# Altium project RheoBoard_V1.PrjPcb (part 2 of 5)
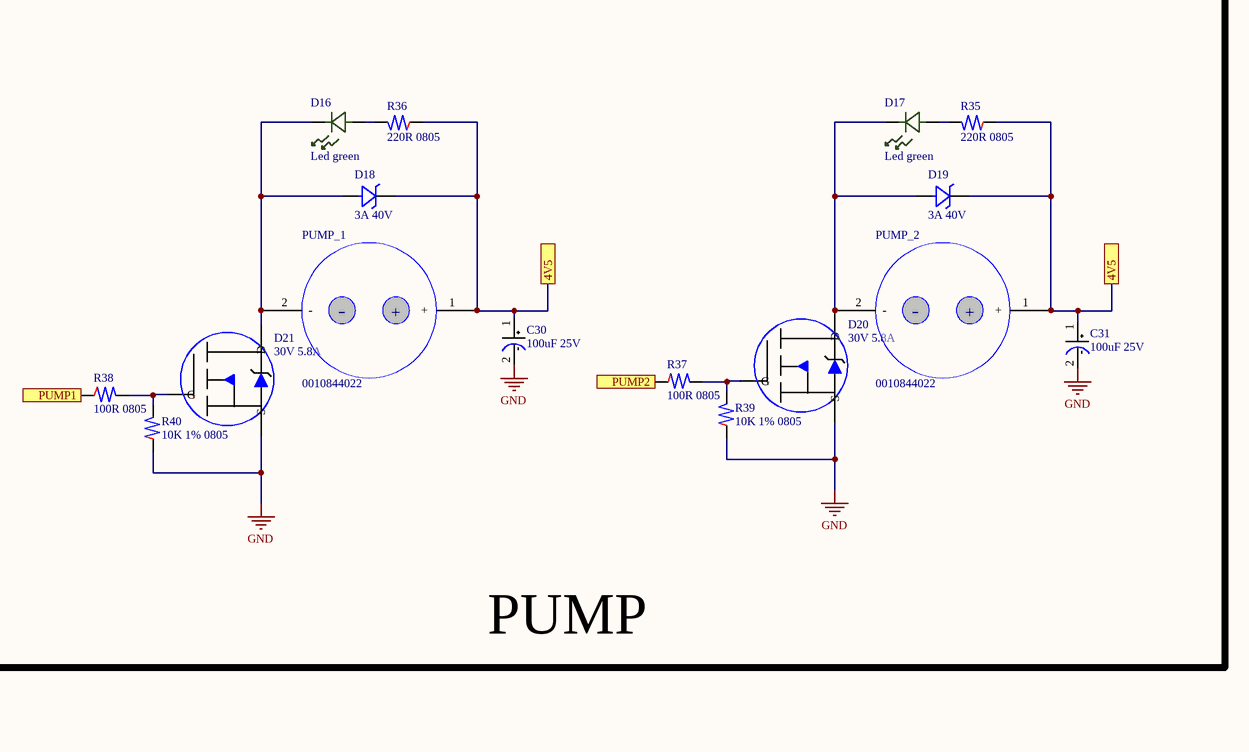
[diagram p11: MAIN.SchDoc, right]

## Sheet MAIN.SchDoc (continued)
### Library data of the parts
C1-C3 C5 C6 = CAP_CER, 0805, X7R, 0.1UF, 5%, 50V: Ceramic Capacitor, Multilayer, Ceramic, 50V, 10% +Tol, 10% -Tol, X7R, 15% TC, 0.1uF, Surface Mount, 0805; Manufacturer: Nextgen; Manufacturer Part Number: 0805B104K500BD; Capacitance: 100nF; LIB MADE BY: MR HOANG; Supplier 1: DigiKey Marketplace; RoHS: Compliant; Category: Ceramic Capacitors; Stock 1: 24000; Pricing 1: 8000=0.0788 (USD); Dielectric Material: Ceramic; Export Control Classification Number (ECCN) Code: EAR99; Height: 850µm; Harmonized Tariff Schedule (HTS) Code: 8532.24.00.20; Length: 2mm; Max Operating Temperature: 125°C; Min Operating Temperature: -55°C; Mount: Surface Mount; Number of Terminals: 2; REACH SVHC: Yes; Voltage Rating (DC): 50V; Width: 1.25mm; ComponentLink1Description: New link; ComponentLink1URL: *; LINK: https://linhkien.cxtvn.com/1976-tu-khong-phan-cuc-0805.html; Supplier Part Number 1: 3372-0805B104K500BDTR-ND
C4 = CAP_CER 0805 1NF 50V ULTRA STABL: Cap Ceramic 0.001uF 50V X8R 10% Pad SMD 0805 150C T/R Automotive AEC-Q200; Manufacturer: Yageo Group; Manufacturer Part Number: C0805C102K5HACAUTO; Temperature Coefficient: 30ppm/°C; LIB MADE BY: MR HOANG; Supplier 1: DigiKey; RoHS: Compliant; Category: Ceramic Capacitors; Stock 1: 54307; Pricing 1: 1=0.18, 10=0.1, 50=0.07, 100=0.0608, 500=0.0454 (USD); Capacitance: 1nF; Case/Package: 0805; China RoHS: Compliant; Country of Origin: Mexico; Dielectric: X8R; Dielectric Material: Ceramic; Export Control Classification Number (ECCN) Code: EAR99; Height: 780µm; Harmonized Tariff Schedule (HTS) Code: 8532.24.00.20; Introduction Date: 2017-10-02; Lead Free: Lead Free; Length: 2mm; Lifecycle Status: Production; Material: Ceramic; Max Operating Temperature: 150°C; Min Operating Temperature: -55°C; Mount: Surface Mount; Number of Terminals: 2; Ratings: AEC-Q200; REACH SVHC: Yes; Voltage Rating: 50V; Voltage Rating (DC): 50V; Width: 1.25mm; ComponentLink1URL: https://datasheet.octopart.com:443/C0805C102K5HACAUTO-KEMET-datasheet-178087918.pdf?src-supplier=IHS; ComponentLink1Description: https://datasheet.octopart.com:443/C0805C102K5HACAUTO-KEMET-datasheet-178087918.pdf?src-supplier=IHS; ComponentLink2URL: https://datasheet.octopart.com:443/C0805C102K5HACAUTO-KEMET-datasheet-68331921.pdf?src-supplier=Upverter; ComponentLink2Description: https://datasheet.octopart.com:443/C0805C102K5HACAUTO-KEMET-datasheet-68331921.pdf?src-supplier=Upverter; ComponentLink3URL: https://datasheet.octopart.com:443/C0805C102K5HACAUTO-KEMET-datasheet-181957571.pdf?src-supplier=Newark; ComponentLink3Description: https://datasheet.octopart.com:443/C0805C102K5HACAUTO-KEMET-datasheet-181957571.pdf?src-supplier=Newark; ComponentLink4URL: https://datasheet.octopart.com:443/C0805C102K5HACAUTO-KEMET-datasheet-181957570.pdf?src-supplier=Newark; ComponentLink4Description: https://datasheet.octopart.com:443/C0805C102K5HACAUTO-KEMET-datasheet-181957570.pdf?src-supplier=Newark; ComponentLink5URL: https://datasheet.octopart.com:443/C0805C102K5HACAUTO-KEMET-datasheet-149523697.pdf?src-supplier=Farnell; ComponentLink5Description: https://datasheet.octopart.com:443/C0805C102K5HACAUTO-KEMET-datasheet-149523697.pdf?src-supplier=Farnell; ComponentLink6URL: https://datasheet.octopart.com:443/C0805C102K5HACAUTO-KEMET-datasheet-138896532.pdf?src-supplier=Farnell; ComponentLink6Description: https://datasheet.octopart.com:443/C0805C102K5HACAUTO-KEMET-datasheet-138896532.pdf?src-supplier=Farnell; ComponentLink7URL: https://datasheet.octopart.com/C0805C102K5HACAUTO-KEMET-datasheet-84169754.pdf; ComponentLink7Description: https://datasheet.octopart.com/C0805C102K5HACAUTO-KEMET-datasheet-84169754.pdf; Supplier Part Number 1: 399-C0805C102K5HACAUTODKR-ND; LINK: https://linhkien.cxtvn.com/3023-tu-102-1nf-0805-50v-10-20c.html
C28-C31 = CAP ALUM POLY 100UF 20% 25V SMD: WCAP-PSLC Aluminum Polymer Capacitors; Manufacturer: Wurth Elektronik; Manufacturer Part Number: 875075561005; Manufacturer Lifecycle Status: ACTIVE; Capacitance: 100µF; ESR (Equivalent Series Resistance): 15mΩ; Leakage Current: 500µA; Life (Hours): 2000hours; Pitch: 10.3mm; Polarity: Polar; Ripple Current: 4.8A; Tolerance: 20%; YEOL: 1 = Estimated lifetime > 10 years; LIB MADE BY: MR HOANG; Supplier 1: DigiKey; RoHS: Compliant; Category: Polymer Capacitors; Stock 1: 825; Pricing 1: 1=1.6, 50=1.363, 100=1.187 (USD); Case/Package: Radial; Diameter: 10mm; Height - Seated (Max): 12.3952mm; Length: 12.4mm; Lifecycle Status: Production; Max Operating Temperature: 105°C; Min Operating Temperature: -55°C; Mount: Surface Mount; Packaging: Tape & Reel (TR); REACH SVHC: Unknown; Voltage Rating: 25V; Voltage Rating (DC): 25V; Width: 10.3mm; ComponentLink1URL: https://datasheet.octopart.com:443/875075561005-Wurth-Elektronik-datasheet-168509076.pdf?src-supplier=Wurth+Elektronik; ComponentLink1Description: https://datasheet.octopart.com:443/875075561005-Wurth-Elektronik-datasheet-168509076.pdf?src-supplier=Wurth+Elektronik; ComponentLink2URL: https://datasheet.octopart.com:443/875075561005-W%C3%BCrth-Elektronik-datasheet-37144729.pdf?src-supplier=Newark; ComponentLink2Description: https://datasheet.octopart.com:443/875075561005-W%C3%BCrth-Elektronik-datasheet-37144729.pdf?src-supplier=Newark; Supplier Part Number 1: 732-6499-6-ND; LINK: https://linhkien.cxtvn.com/7789-edk107m025a9laa-cap-alum-100uf-20-25v-smd-8383mm.html
D1 D3 D5 D7 D14 D15 D20 D21 = MOSFET N-CH 30V 5.8A SOT23-3: Trans MOSFET N-CH 30V 5.7A 3-Pin SOT-23; Manufacturer: Alpha & Omega Semiconductor; Manufacturer Part Number: AO3400A; Drain to Source Resistance: 26.5mΩ; Gate to Source Voltage (Vgs): 12V; Input Capacitance: 630pF; Max Junction Temperature (Tj): 150°C; Max Power Dissipation: 1.4W; Number of Channels: 1; Threshold Voltage: 650mV; Turn-Off Delay Time: 25ns; Turn-On Delay Time: 3ns; LIB MADE BY: MR HOANG; Supplier 1: DigiKey; RoHS: Compliant; Category: MOSFETs; Stock 1: 170121; Pricing 1: 3000=0.11563, 6000=0.10504, 9000=0.09963, 15000=0.09356, 21000=0.08996, 30000=0.08647 (USD); Case/Package: SOT-23; Continuous Drain Current (ID): 5.7A; Country of Origin: Mainland China; Drain to Source Breakdown Voltage: 30V; Drain to Source Voltage (Vdss): 30V; Export Control Classification Number (ECCN) Code: EAR99; Height: 1.25mm; Introduction Date: 2007-04-17; Lead Free: Lead Free; Lifecycle Status: Production; Max Operating Temperature: 150°C; Min Breakdown Voltage: 30V; Min Operating Temperature: -55°C; Mount: Surface Mount; Number of Elements: 1; Number of Pins: 3; Number of Terminals: 3; Power Dissipation: 1.4W; Radiation Hardening: No; Rds On Max: 26.5mΩ; REACH SVHC: Yes; Schedule B: 8541290080, 8541290080|8541290080|8541290080|8541290080|8541290080; ComponentLink1URL: https://sigma.octopart.com:443/140150677/technical_drawing/Alpha-%26-Omega-Semiconductor-AO3400A.pdf?src-supplier=Alpha+%26+Omega+Semiconductor+SCT; ComponentLink1Description: https://sigma.octopart.com:443/140150677/technical_drawing/Alpha-%26-Omega-Semiconductor-AO3400A.pdf?src-supplier=Alpha+%26+Omega+Semiconductor+SCT; ComponentLink2URL: https://datasheet.octopart.com:443/AO3400A-Alpha-%26-Omega-Semiconductor-datasheet-11777925.pdf?src-supplier=IHS; ComponentLink2Description: https://datasheet.octopart.com:443/AO3400A-Alpha-%26-Omega-Semiconductor-datasheet-11777925.pdf?src-supplier=IHS; ComponentLink3URL: https://sigma.octopart.com:443/138895710/technical_drawing/Alpha-%26-Omega-Semiconductor-AO3400A.pdf?src-supplier=Upverter; ComponentLink3Description: https://sigma.octopart.com:443/138895710/technical_drawing/Alpha-%26-Omega-Semiconductor-AO3400A.pdf?src-supplier=Upverter; ComponentLink4URL: https://datasheet.octopart.com:443/AO3400A-Alpha-%26-Omega-Semiconductor-datasheet-14060799.pdf?src-supplier=iiiC; ComponentLink4Description: https://datasheet.octopart.com:443/AO3400A-Alpha-%26-Omega-Semiconductor-datasheet-14060799.pdf?src-supplier=iiiC; ComponentLink5URL: https://datasheet.octopart.com:443/AO3400A-Alpha-%26-Omega-Semiconductor-datasheet-5402508.pdf?src-supplier=Verical; ComponentLink5Description: https://datasheet.octopart.com:443/AO3400A-Alpha-%26-Omega-Semiconductor-datasheet-5402508.pdf?src-supplier=Verical; Supplier Part Number 1: 785-1000-2-ND; LINK: https://linhkien.cxtvn.com/2689-ao3400-mosfet-n-ch-30v-58a-sot23-3-2c.html
D10 D11 D16 D17 LED4-LED6 = LED GREEN CLEAR CHIP SMD: Single-color LEDs; LITEON; LTST-C190GKT; Green; 130 °; 2.1 V; 0603; Manufacturer: Diodes Inc.; Current: 1A; Dominant Wavelength: 569nm; Forward Current: 30mA; Forward Voltage: 2.6V; Lens Color: Clear, Colorless; Lens Style: Clear; Luminous Intensity: 1.8mcd; Number of Circuits: 1; Peak Wavelength: 565nm; Power Dissipation: 100mW; Reverse Voltage: 5V; Shape: Rectangular; Test Current: 10mA; Viewing Angle: 130°; Voltage: 2V; LIB MADE BY: MR HOANG; Supplier: DigiKey; Supplier Part Number: 160-LTST-C190GKTDKR-ND; Manufacturer Part Number: LTST-C190GKT; RoHS: Compliant; Category: LEDs; Stock: 1226903; Pricing: 1=0.14, 10=0.096, 100=0.0662, 500=0.05232, 1000=0.0477, 2000=0.04374 (USD); Case/Package: 0603; Case Code (Imperial): 0603; Case Code (Metric): 1608; China RoHS: Compliant; Color: Green; Contact Plating: Tin; Country of Origin: Mainland China; Depth: 800µm; Export Control Classification Number (ECCN) Code: EAR99; Height: 800µm; Harmonized Tariff Schedule (HTS) Code: 8541.40.20.00; Illumination Color: Green; Introduction Date: 1997-12-01; Lead Free: Lead Free; Length: 1.6mm; Lens Transparency: Clear; Lifecycle Status: NRND; Max Operating Temperature: 85°C; Min Operating Temperature: -55°C; Mounting Technology: Surface Mount; Number of Elements: 1; Number of LEDs: 1; Pins: 2; Number of Terminals: 2; Power Rating: 100mW; Radiation Hardening: No; REACH SVHC: Yes; Schedule B: 8541402000, 8541402000|8541402000|8541402000|8541402000|8541402000; Terminal Pitch: 1.5mm; Wavelength: 569nm; Width: 800µm; ComponentLink1URL: https://datasheet.octopart.com:443/LTST-C190GKT-Lite-On-datasheet-66499085.pdf?src-supplier=IHS; ComponentLink1Description: https://datasheet.octopart.com:443/LTST-C190GKT-Lite-On-datasheet-66499085.pdf?src-supplier=IHS; ComponentLink2URL: https://datasheet.octopart.com:443/LTST-C190GKT-Lite-On-datasheet-158530.pdf?src-supplier=Electro+Sonic; ComponentLink2Description: https://datasheet.octopart.com:443/LTST-C190GKT-Lite-On-datasheet-158530.pdf?src-supplier=Electro+Sonic; ComponentLink3URL: https://datasheet.octopart.com:443/LTST-C190GKT-Lite-On-datasheet-87079182.pdf?src-supplier=Upverter; ComponentLink3Description: https://datasheet.octopart.com:443/LTST-C190GKT-Lite-On-datasheet-87079182.pdf?src-supplier=Upverter; ComponentLink4URL: https://datasheet.octopart.com:443/LTST-C190GKT-Lite-On-datasheet-7279162.pdf?src-supplier=Future+Electronics; ComponentLink4Description: https://datasheet.octopart.com:443/LTST-C190GKT-Lite-On-datasheet-7279162.pdf?src-supplier=Future+Electronics; ComponentLink5URL: https://datasheet.octopart.com:443/LTST-C190GKT-Lite-On-datasheet-86397319.pdf?src-supplier=Future+Electronics; ComponentLink5Description: https://datasheet.octopart.com:443/LTST-C190GKT-Lite-On-datasheet-86397319.pdf?src-supplier=Future+Electronics; ComponentLink6URL: https://datasheet.octopart.com:443/LTST-C190GKT-Lite-On-datasheet-93383.pdf?src-supplier=DigiKey; ComponentLink6Description: https://datasheet.octopart.com:443/LTST-C190GKT-Lite-On-datasheet-93383.pdf?src-supplier=DigiKey; ComponentLink7URL: https://datasheet.octopart.com:443/LTST-C190GKT-Lite-On-datasheet-14174996.pdf?src-supplier=iiiC; ComponentLink7Description: https://datasheet.octopart.com:443/LTST-C190GKT-Lite-On-datasheet-14174996.pdf?src-supplier=iiiC; ComponentLink8URL: https://datasheet.octopart.com:443/LTST-C190GKT-Lite-On-datasheet-62340971.pdf?src-supplier=TME; ComponentLink8Description: https://datasheet.octopart.com:443/LTST-C190GKT-Lite-On-datasheet-62340971.pdf?src-supplier=TME; Link: https://www.thegioiic.com/led-xanh-la-0603-dan-smd-trong-suot
D12 D13 D18 D19 = DIODE SCHOTTKY 40V 3A DO214AB: Rectifier Diode, Schottky, 1 Phase, 1 Element, 3A, 40V V(RRM), Silicon, DO-214AB; Manufacturer: onsemi; Manufacturer Part Number: SS34; Manufacturer Lifecycle Status: ACTIVE; Element Configuration: Single; Forward Voltage: 500mV; Max Forward Surge Current (Ifsm): 100A; Max Junction Temperature (Tj): 150°C; Max Power Dissipation: 2.27W; Max Reverse Leakage Current: 500µA; Number of Elements: 1; Peak Reverse Current: 20mA; Polarity: Standard; LIB MADE BY: MR HOANG; Supplier 1: DigiKey; RoHS: Compliant; Category: Schottky Diodes; Stock 1: 73284; Pricing 1: 1=1.01, 10=0.631, 100=0.4108, 500=0.31576, 1000=0.28514 (USD); Average Rectified Current: 3A; Case/Package: SMC; China RoHS: Non-Compliant; Contact Plating: Tin; Current: 3A; Current Rating: 3A; Export Control Classification Number (ECCN) Code: EAR99; Forward Current: 3A; Height: 2.65mm; Harmonized Tariff Schedule (HTS) Code: 8541.10.00.80; Introduction Date: 1999-01-01; Lead Free: Lead Free; Length: 7.15mm; Lifecycle Status: Production; Max Operating Temperature: 150°C; Max Output Current: 3A; Max Repetitive Reverse Voltage (Vrrm): 40V; Max Reverse Voltage (DC): 40V; Max Surge Current: 100A; Min Operating Temperature: -55°C; Mount: Surface Mount; Number of Pins: 2; Number of Terminals: 2; Output Current: 3A; Packaging: Cut Tape; Peak Non-Repetitive Surge Current: 100A; Radiation Hardening: No; REACH SVHC: No; Reverse Standoff Voltage: 40V; Schedule B: 8541100080, 8541100080|8541100080|8541100080|8541100080|8541100080; Voltage: 40V; Voltage Rating (DC): 40V; Width: 6.25mm; ComponentLink1URL: https://datasheet.octopart.com:443/SS34-onsemi-datasheet-180969540.pdf?src-supplier=IHS; ComponentLink1Description: https://datasheet.octopart.com:443/SS34-onsemi-datasheet-180969540.pdf?src-supplier=IHS; ComponentLink2URL: https://datasheet.octopart.com:443/SS34-Fairchild-Semiconductor-datasheet-182300316.pdf?src-supplier=IHS; ComponentLink2Description: https://datasheet.octopart.com:443/SS34-Fairchild-Semiconductor-datasheet-182300316.pdf?src-supplier=IHS; ComponentLink3URL: https://datasheet.octopart.com:443/SS34-ON-Semiconductor-datasheet-98150820.pdf?src-supplier=Upverter; ComponentLink3Description: https://datasheet.octopart.com:443/SS34-ON-Semiconductor-datasheet-98150820.pdf?src-supplier=Upverter; ComponentLink4URL: https://sigma.octopart.com:443/138897342/technical_drawing/ON-Semiconductor-SS34.pdf?src-supplier=Upverter; ComponentLink4Description: https://sigma.octopart.com:443/138897342/technical_drawing/ON-Semiconductor-SS34.pdf?src-supplier=Upverter; ComponentLink5URL: https://datasheet.octopart.com:443/SS34-Fairchild-datasheet-10247.pdf?src-supplier=Fairchild+Semiconductor; ComponentLink5Description: https://datasheet.octopart.com:443/SS34-Fairchild-datasheet-10247.pdf?src-supplier=Fairchild+Semiconductor; ComponentLink6URL: https://datasheet.octopart.com:443/SS34-ON-Semiconductor-datasheet-21199498.pdf?src-supplier=Fairchild+Semiconductor; ComponentLink6Description: https://datasheet.octopart.com:443/SS34-ON-Semiconductor-datasheet-21199498.pdf?src-supplier=Fairchild+Semiconductor; ComponentLink7URL: https://sigma.octopart.com:443/17345394/technical_drawing/Fairchild-Semiconductor-SS34.pdf?src-supplier=Fairchild+Semiconductor; ComponentLink7Description: https://sigma.octopart.com:443/17345394/technical_drawing/Fairchild-Semiconductor-SS34.pdf?src-supplier=Fairchild+Semiconductor; ComponentLink8URL: https://datasheet.octopart.com:443/SS34-ON-Semiconductor-datasheet-137362514.pdf?src-supplier=onsemi; ComponentLink8Description: https://datasheet.octopart.com:443/SS34-ON-Semiconductor-datasheet-137362514.pdf?src-supplier=onsemi; ComponentLink9URL: https://datasheet.octopart.com:443/SS34-ON-Semiconductor-datasheet-85599191.pdf?src-supplier=onsemi; ComponentLink9Description: https://datasheet.octopart.com:443/SS34-ON-Semiconductor-datasheet-85599191.pdf?src-supplier=onsemi; ComponentLink10URL: https://datasheet.octopart.com:443/SS34-ON-Semiconductor-datasheet-86698610.pdf?src-supplier=onsemi; ComponentLink10Description: https://datasheet.octopart.com:443/SS34-ON-Semiconductor-datasheet-86698610.pdf?src-supplier=onsemi; ComponentLink11URL: https://datasheet.octopart.com:443/SS34-ON-Semiconductor-datasheet-86692994.pdf?src-supplier=Farnell; ComponentLink11Description: https://datasheet.octopart.com:443/SS34-ON-Semiconductor-datasheet-86692994.pdf?src-supplier=Farnell; ComponentLink12URL: https://datasheet.octopart.com:443/SS34-Fairchild-Semiconductor-datasheet-16207785.pdf?src-supplier=Farnell; ComponentLink12Description: https://datasheet.octopart.com:443/SS34-Fairchild-Semiconductor-datasheet-16207785.pdf?src-supplier=Farnell; ComponentLink13URL: https://datasheet.octopart.com:443/SS34-Fairchild-Semiconductor-datasheet-17852663.pdf?src-supplier=Newark; ComponentLink13Description: https://datasheet.octopart.com:443/SS34-Fairchild-Semiconductor-datasheet-17852663.pdf?src-supplier=Newark; ComponentLink14URL: https://datasheet.octopart.com:443/SS34-Fairchild-Semiconductor-datasheet-66805556.pdf?src-supplier=Newark; ComponentLink14Description: https://datasheet.octopart.com:443/SS34-Fairchild-Semiconductor-datasheet-66805556.pdf?src-supplier=Newark; ComponentLink15URL: https://datasheet.octopart.com:443/SS34-ON-Semiconductor-datasheet-137713514.pdf?src-supplier=TME; ComponentLink15Description: https://datasheet.octopart.com:443/SS34-ON-Semiconductor-datasheet-137713514.pdf?src-supplier=TME; ComponentLink16URL: https://datasheet.octopart.com:443/SS34-Fairchild-Semiconductor-datasheet-10520288.pdf?src-supplier=Jameco+(USA); ComponentLink16Description: https://datasheet.octopart.com:443/SS34-Fairchild-Semiconductor-datasheet-10520288.pdf?src-supplier=Jameco+(USA); ComponentLink17URL: https://datasheet.octopart.com:443/SS34.-Fairchild-Semiconductor-datasheet-8187732.pdf?src-supplier=Jameco+(USA); ComponentLink17Description: https://datasheet.octopart.com:443/SS34.-Fairchild-Semiconductor-datasheet-8187732.pdf?src-supplier=Jameco+(USA); ComponentLink18URL: https://datasheet.octopart.com:443/SS34-Fairchild-Semiconductor-datasheet-14041527.pdf?src-supplier=iiiC; ComponentLink18Description: https://datasheet.octopart.com:443/SS34-Fairchild-Semiconductor-datasheet-14041527.pdf?src-supplier=iiiC; ComponentLink19URL: https://datasheet.octopart.com:443/SS34-Fairchild-datasheet-3545.pdf?src-supplier=DigiKey; ComponentLink19Description: https://datasheet.octopart.com:443/SS34-Fairchild-datasheet-3545.pdf?src-supplier=DigiKey; ComponentLink20URL: https://datasheet.octopart.com:443/SS34-Fairchild-Semiconductor-datasheet-67150810.pdf?src-supplier=element14+APAC; ComponentLink20Description: https://datasheet.octopart.com:443/SS34-Fairchild-Semiconductor-datasheet-67150810.pdf?src-supplier=element14+APAC; ComponentLink21URL: https://datasheet.octopart.com:443/SS34-Fairchild-Semiconductor-datasheet-67301494.pdf?src-supplier=element14+APAC; ComponentLink21Description: https://datasheet.octopart.com:443/SS34-Fairchild-Semiconductor-datasheet-67301494.pdf?src-supplier=element14+APAC; ComponentLink22URL: https://datasheet.octopart.com:443/SS34-Fairchild-Semiconductor-datasheet-68552117.pdf?src-supplier=element14+APAC; ComponentLink22Description: https://datasheet.octopart.com:443/SS34-Fairchild-Semiconductor-datasheet-68552117.pdf?src-supplier=element14+APAC; ComponentLink23URL: http://sigma.octopart.com:80/150631730/rohs_statement/ON-Semiconductor-SS34.pdf?src-supplier=Compliance+Statements; ComponentLink23Description: http://sigma.octopart.com:80/150631730/rohs_statement/ON-Semiconductor-SS34.pdf?src-supplier=Compliance+Statements; ComponentLink24URL: http://sigma.octopart.com:80/17357496/reach_statement/Fairchild-Semiconductor-SS34.pdf?src-supplier=Compliance+Statements; ComponentLink24Description: http://sigma.octopart.com:80/17357496/reach_statement/Fairchild-Semiconductor-SS34.pdf?src-supplier=Compliance+Statements; ComponentLink25URL: http://sigma.octopart.com:80/17357497/materials_sheet/Fairchild-Semiconductor-SS34.pdf?src-supplier=Compliance+Statements; ComponentLink25Description: http://sigma.octopart.com:80/17357497/materials_sheet/Fairchild-Semiconductor-SS34.pdf?src-supplier=Compliance+Statements; ComponentLink26URL: http://sigma.octopart.com:80/33332724/reach_statement/Fairchild-Semiconductor-SS34.pdf?src-supplier=Compliance+Statements; ComponentLink26Description: http://sigma.octopart.com:80/33332724/reach_statement/Fairchild-Semiconductor-SS34.pdf?src-supplier=Compliance+Statements; ComponentLink27URL: http://sigma.octopart.com:80/33332734/materials_sheet/Fairchild-Semiconductor-SS34.pdf?src-supplier=Compliance+Statements; ComponentLink27Description: http://sigma.octopart.com:80/33332734/materials_sheet/Fairchild-Semiconductor-SS34.pdf?src-supplier=Compliance+Statements; ComponentLink28URL: http://sigma.octopart.com:80/reach_statement/ON-Semiconductor-company-79.pdf?src-supplier=Compliance+Statements; ComponentLink28Description: http://sigma.octopart.com:80/reach_statement/ON-Semiconductor-company-79.pdf?src-supplier=Compliance+Statements; ComponentLink29URL: http://sigma.octopart.com:80/rohs_statement/Fairchild-Semiconductor-company-11.pdf?src-supplier=Compliance+Statements; ComponentLink29Description: http://sigma.octopart.com:80/rohs_statement/Fairchild-Semiconductor-company-11.pdf?src-supplier=Compliance+Statements; ComponentLink30URL: http://sigma.octopart.com:80/rohs_statement/Fairchild-Semiconductor-company-10.pdf?src-supplier=Compliance+Statements; ComponentLink30Description: http://sigma.octopart.com:80/rohs_statement/Fairchild-Semiconductor-company-10.pdf?src-supplier=Compliance+Statements; ComponentLink31URL: http://sigma.octopart.com:80/reach_statement/Fairchild-Semiconductor-company-9.pdf?src-supplier=Compliance+Statements; ComponentLink31Description: http://sigma.octopart.com:80/reach_statement/Fairchild-Semiconductor-company-9.pdf?src-supplier=Compliance+Statements; ComponentLink32URL: https://octopart.com:443/opatz8j6/c1?t=viccNpvfIttKsDU7SPWQ9y4zH2I5vQeoMbVHGqsPow6bTd-4svAQ8CJcd4JU32n4VIK7bfuhyC2yX38EOaXgXF3OB3U3oRNmsYMqF9qk35vU8wFPIavaR-14DwP6fbfQaPsGNFdN_Z8-1T4X_QOZn0ACTRQW8byAb0Zw5uR49QIr8HPTSX9wA8MtVUNYB4ZuZLRADJrwn9SaYPFjqtJKagfgGDofRU13OmWhy1c_plwGeXj2LiYJThcM9cEbMjTH7xu2uABYmy4NIzY74J7Q8JiWqla3RWJM-LTvXAKkcB--a8DU9_B_J9ViBINNo7GXDBnyWrsQ2PdViVATqoeVAswpd3Ua_w&src-supplier=Compliance+Statements; ComponentLink32Description: https://octopart.com:443/opatz8j6/c1?t=viccNpvfIttKsDU7SPWQ9y4zH2I5vQeoMbVHGqsPow6bTd-4svAQ8CJcd4JU32n4VIK7bfuhyC2yX38EOaXgXF3OB3U3oRNmsYMqF9qk35vU8wFPIavaR-14DwP6fbfQaPsGNFdN_Z8-1T4X_QOZn0ACTRQW8byAb0Zw5uR49QIr8HPTSX9wA8MtVUNYB4ZuZLRADJrwn9SaYPFjqtJKagfgGDofRU13OmWhy1c_plwGeXj2LiYJThcM9cEbMjTH7xu2uABYmy4NIzY74J7Q8JiWqla3RWJM-LTvXAKkcB--a8DU9_B_J9ViBINNo7GXDBnyWrsQ2PdViVATqoeVAswpd3Ua_w&src-supplier=Compliance+Statements; ComponentLink33URL: https://octopart.com:443/opatz8j6/c1?t=_Ew93NvA2dxwG6kofQaAnix6stlPTBjPbyWmO8Db9aMsASW0CRA-VD1GC5YrCPo5xMBMEc6PkW8nBAY-0ID6v98fVxoORUlMO7vUnc_LZQaUFcYwmy1pBK1xo08PDWFDFZQRA7yrC4Tgb3hqyw82Mhwc0TN8rdOHKrHbVJO-oT1u6EL8bRFOXGwObUWVyqJ9akJ_x2PJn8JCfxM8_Cnyz0kH90ZX7GKj6RwTms2s29FGBjvYi_glDXbA6upBMQv93sulurvZj4MQPnuGeqiiX-cFrWyFyjjroUcoWjQY0FBSydzhr6MAJmz09WkbpGZ5S232seQDF-n-PlgN17JSkdMRcdJN-sU&src-supplier=Compliance+Statements; ComponentLink33Description: https://octopart.com:443/opatz8j6/c1?t=_Ew93NvA2dxwG6kofQaAnix6stlPTBjPbyWmO8Db9aMsASW0CRA-VD1GC5YrCPo5xMBMEc6PkW8nBAY-0ID6v98fVxoORUlMO7vUnc_LZQaUFcYwmy1pBK1xo08PDWFDFZQRA7yrC4Tgb3hqyw82Mhwc0TN8rdOHKrHbVJO-oT1u6EL8bRFOXGwObUWVyqJ9akJ_x2PJn8JCfxM8_Cnyz0kH90ZX7GKj6RwTms2s29FGBjvYi_glDXbA6upBMQv93sulurvZj4MQPnuGeqiiX-cFrWyFyjjroUcoWjQY0FBSydzhr6MAJmz09WkbpGZ5S232seQDF-n-PlgN17JSkdMRcdJN-sU&src-supplier=Compliance+Statements; Supplier Part Number 1: SS34FSCT-ND; LINK: https://linhkien.cxtvn.com/6533-ss34-diode-3a-40v.html
J1 J3-J5 = QWIIC CONNECTOR SMD 4-PIN: Manufacturer: SparkFun; LIB MADE BY: MR HOANG; Supplier 1: DigiKey; Manufacturer Part Number: 14417; Category: Connectors; Stock 1: 5760; Pricing 1: 1=0.6 (USD); Supplier Part Number 1: 1568-14417-ND; LINK: https://www.lcsc.com/product-detail/C2859067.html?s_z=n_q_t_14417&spm=wm.fly.bg.5.xh___wm.ssy.tc.2.tz&lcsc_vid=FlMMUgJST1FcAwECRwALVlxQQAdaX1xfRFUPAlJUQFExVlNeTlFfV1NTRFRXUzsOAxUeFF5JWBYZEEoKFBINSQcJGk4MFQUIE0wKAhAHHg1BVlVWWQkaCgg%3D
J2 J7 = CONN HEADER VERT 4POS 2.54MM: Samtec 2.54mmpitch4pSingle row pin header, TSseries, right angle, Through hole mounting; Manufacturer Lifecycle Status: PRODUCTION; Gender: Male; Number of Contacts: 4; Pitch: 2.54mm; LIB MADE BY: MR HOANG; Supplier 1: DigiKey; Manufacturer: Samtec; Manufacturer Part Number: TS-104-T-A; RoHS: Compliant; Category: Headers and Wire Housings; Stock 1: 3883; Pricing 1: 1=0.79, 10=0.674, 100=0.5725, 500=0.51098, 1000=0.48658, 5000=0.43436, 10000=0.41364 (USD); Color: Black; Contact Material: Brass; Contact Mating Length: 4.2164mm; Contact Plating: Tin; Height: 2.54mm; Housing Color: Black; Housing Material: Plastic; Lead Free: Lead Free; Length: 10.2mm; Lifecycle Status: Production; Mount: Through Hole; Number of Positions: 4; Number of Rows: 1; Packaging: Bulk; Radiation Hardening: No; REACH SVHC: Unaffected; Schedule B: 8536694040, 8536694040|8536694040|8536694040|8536694040|8536694040; Termination: Solder; Width: 2.54mm; ComponentLink1URL: https://datasheet.octopart.com:443/TS-104-T-A-Samtec-datasheet-97318998.pdf?src-supplier=Electro+Sonic; ComponentLink1Description: https://datasheet.octopart.com:443/TS-104-T-A-Samtec-datasheet-97318998.pdf?src-supplier=Electro+Sonic; ComponentLink2URL: https://datasheet.octopart.com:443/TS-104-T-A-Samtec-datasheet-118235246.pdf?src-supplier=Electro+Sonic; ComponentLink2Description: https://datasheet.octopart.com:443/TS-104-T-A-Samtec-datasheet-118235246.pdf?src-supplier=Electro+Sonic; ComponentLink3URL: https://datasheet.octopart.com:443/TS-104-T-A-Samtec-datasheet-41643166.pdf?src-supplier=Newark; ComponentLink3Description: https://datasheet.octopart.com:443/TS-104-T-A-Samtec-datasheet-41643166.pdf?src-supplier=Newark; ComponentLink4URL: https://datasheet.octopart.com:443/TS-104-T-A-Samtec-datasheet-13698575.pdf?src-supplier=Newark; ComponentLink4Description: https://datasheet.octopart.com:443/TS-104-T-A-Samtec-datasheet-13698575.pdf?src-supplier=Newark; ComponentLink5URL: https://datasheet.octopart.com:443/TS-104-T-A-Samtec-datasheet-175953447.pdf?src-supplier=JRH+Electronics; ComponentLink5Description: https://datasheet.octopart.com:443/TS-104-T-A-Samtec-datasheet-175953447.pdf?src-supplier=JRH+Electronics; ComponentLink6URL: https://datasheet.octopart.com:443/TS-104-T-A-Samtec-datasheet-150856305.pdf?src-supplier=Sager+Electronics; ComponentLink6Description: https://datasheet.octopart.com:443/TS-104-T-A-Samtec-datasheet-150856305.pdf?src-supplier=Sager+Electronics; ComponentLink7URL: https://datasheet.octopart.com:443/TS-104-T-A-Samtec-datasheet-179090728.pdf?src-supplier=Sager+Electronics; ComponentLink7Description: https://datasheet.octopart.com:443/TS-104-T-A-Samtec-datasheet-179090728.pdf?src-supplier=Sager+Electronics; ComponentLink8URL: https://datasheet.octopart.com:443/TS-104-T-A-Samtec-datasheet-116533476.pdf?src-supplier=Toby+Electronics; ComponentLink8Description: https://datasheet.octopart.com:443/TS-104-T-A-Samtec-datasheet-116533476.pdf?src-supplier=Toby+Electronics; ComponentLink9URL: https://datasheet.octopart.com:443/TS-104-T-A-Samtec-datasheet-116536303.pdf?src-supplier=Toby+Electronics; ComponentLink9Description: https://datasheet.octopart.com:443/TS-104-T-A-Samtec-datasheet-116536303.pdf?src-supplier=Toby+Electronics; ComponentLink10URL: https://datasheet.octopart.com:443/TS-104-T-A-Samtec-datasheet-28904454.pdf?src-supplier=Farnell; ComponentLink10Description: https://datasheet.octopart.com:443/TS-104-T-A-Samtec-datasheet-28904454.pdf?src-supplier=Farnell; ComponentLink11URL: https://datasheet.octopart.com:443/TS-104-T-A-Samtec-datasheet-8451641.pdf?src-supplier=Farnell; ComponentLink11Description: https://datasheet.octopart.com:443/TS-104-T-A-Samtec-datasheet-8451641.pdf?src-supplier=Farnell; ComponentLink12URL: https://datasheet.octopart.com:443/TS-104-T-A-Samtec-datasheet-140570800.pdf?src-supplier=Arrow.cn; ComponentLink12Description: https://datasheet.octopart.com:443/TS-104-T-A-Samtec-datasheet-140570800.pdf?src-supplier=Arrow.cn; Supplier Part Number 1: 612-TS-104-T-A-ND; LINK: https://linhkien.cxtvn.com/5709-jump-duc-don-1x4p-254mm-chan-thang-20c.html
J8 J9 = CONN HEADER VERT 2POS 2.5MM: Board Connector, 2 Contact(s), 1 Row(s), Male, Straight, Solder Terminal; Manufacturer: JST; Manufacturer Part Number: B2B-XH-A; Contact Resistance: 20mΩ; Current Rating: 3A; Insulation Resistance: 1GΩ; LIB MADE BY: MR HOANG; Supplier 1: DigiKey; RoHS: Compliant; Category: Card Edge Connectors; Stock 1: 167385; Pricing 1: 1=0.1, 10=0.073, 100=0.0618, 500=0.05514, 1000=0.05251, 5000=0.04686, 10000=0.04463 (USD); Contact Gender: Male; Contact Material: Brass; Housing Material: Nylon; Lifecycle Status: Production; Max Operating Temperature: 85°C; Min Operating Temperature: -25°C; Number of Pins: 2; Number of Rows: 1; Orientation: Straight; Terminal Pitch: 2.54mm; ComponentLink1URL: https://datasheet.octopart.com:443/B2B-XH-A-JST-datasheet-157850277.pdf?src-supplier=IHS; ComponentLink1Description: https://datasheet.octopart.com:443/B2B-XH-A-JST-datasheet-157850277.pdf?src-supplier=IHS; ComponentLink2URL: https://datasheet.octopart.com:443/B2B-XH-A-JST-datasheet-10026044.pdf?src-supplier=TME; ComponentLink2Description: https://datasheet.octopart.com:443/B2B-XH-A-JST-datasheet-10026044.pdf?src-supplier=TME; Supplier Part Number 1: 455-B2B-XH-A-ND; LINK: https://linhkien.cxtvn.com/8989-3-641215-2-connector-header-vert-2pos-254mm.html
LED1-LED3 = LED RED DIFFUSED 0805 SMD: Red 633nm LED Indication - Discrete 2V 0805 (2012 Metric); Manufacturer: Osram; Manufacturer Part Number: LS R976-NR-1-0-20-R18; LIB MADE BY: MR HOANG; Supplier 1: DigiKey; Category: LEDs; Stock 1: 254416; Pricing 1: 1=0.15, 10=0.102, 100=0.0704, 500=0.05582, 1000=0.05095, 2000=0.04679 (USD); Schedule B: 8541402000, 8541402000|8541402000, 8541402000|8541402000|8541402000, 8541402000|8541402000|8541402000|8541402000; Supplier Part Number 1: 475-LSR976-NR-1CT-ND; Link: https://linhkien.cxtvn.com/10106-17-21surcs530-a3tr8-led-red-0805-624nm-10c.html
PUMP_1 PUMP_2 = Air Pump and Vacuum DC Motor - 4.5 V and 2.5 LPM - ZR370-02PM: Connector Header 2 Position 6.35mm Solder Straight Thru-Hole 2 Terminal 1 Port MLX-Series; Manufacturer: Molex; Manufacturer Lifecycle Status: ACTIVE; Connector Type: Power; Contact Resistance: 3.5mΩ; Current Rating: 13.5A; Dielectric Material: Polyester; Gender: Female; Glow Wire Compliant: Non-compliant; Insulation Resistance: 1GΩ; Number of Circuits: 2; Operating Force: 6.672N; Plating: Tin; Plating Thickness: 3.5052µm; Ratings: CSA; Voltage Rating: 600V; LIB MADE BY: MR HOANG; Supplier 1: DigiKey; Manufacturer Part Number: 10-84-4022; RoHS: Compliant; Category: Headers and Wire Housings; Stock 1: 11507; Pricing 1: 1=0.51, 10=0.436, 100=0.3706, 500=0.33078, 1836=0.30175, 5508=0.27924, 11016=0.26592 (USD); China RoHS: Compliant; Color: Natural; Contact Gender: Female; Contact Material: Bronze; Contact Plating: Tin; Country of Origin: US; Export Control Classification Number (ECCN) Code: EAR99; Flammability Rating: UL94 V-2; Halogen Free: Low Halogen; Housing Material: Nylon; Harmonized Tariff Schedule (HTS) Code: 8536.69.40.30; Introduction Date: 1994-12-01; Lead Free: Lead Free; Lifecycle Status: Production; Max Operating Temperature: 105°C; Min Operating Temperature: -55°C; Mount: Through Hole; Number of Contacts: 2; Number of Pins: 2; Number of Positions: 2; Number of Rows: 1; Orientation: Vertical; Packaging: Carton; Pitch: 6.35mm; Radiation Hardening: No; REACH SVHC: Unaffected; Schedule B: 8536694040, 8536694040|8536694040|8536694040|8536694040|8536694040; Shell Material: POLYAMIDE66; Terminal Pitch: 6.35mm; Termination: Solder; ComponentLink1URL: https://datasheet.octopart.com:443/10-84-4022-Molex-datasheet-137053637.pdf?src-supplier=element14+APAC; ComponentLink1Description: https://datasheet.octopart.com:443/10-84-4022-Molex-datasheet-137053637.pdf?src-supplier=element14+APAC; ComponentLink2URL: https://datasheet.octopart.com:443/10-84-4022-Molex-datasheet-13791970.pdf?src-supplier=Molex; ComponentLink2Description: https://datasheet.octopart.com:443/10-84-4022-Molex-datasheet-13791970.pdf?src-supplier=Molex; ComponentLink3URL: https://sigma.octopart.com:443/16272272/technical_drawing/Molex-10-84-4022.pdf?src-supplier=Molex; ComponentLink3Description: https://sigma.octopart.com:443/16272272/technical_drawing/Molex-10-84-4022.pdf?src-supplier=Molex; ComponentLink4URL: https://datasheet.octopart.com:443/010844022-Molex-datasheet-5390850.pdf?src-supplier=Molex; ComponentLink4Description: https://datasheet.octopart.com:443/010844022-Molex-datasheet-5390850.pdf?src-supplier=Molex; ComponentLink5URL: https://datasheet.octopart.com:443/10-84-4022-Molex-datasheet-193058052.pdf?src-supplier=JRH+Electronics; ComponentLink5Description: https://datasheet.octopart.com:443/10-84-4022-Molex-datasheet-193058052.pdf?src-supplier=JRH+Electronics; ComponentLink6URL: https://datasheet.octopart.com:443/10-84-4022-Molex-datasheet-154742841.pdf?src-supplier=JRH+Electronics; ComponentLink6Description: https://datasheet.octopart.com:443/10-84-4022-Molex-datasheet-154742841.pdf?src-supplier=JRH+Electronics; ComponentLink7URL: https://datasheet.octopart.com:443/10-84-4022-Molex-datasheet-33343972.pdf?src-supplier=Electro+Sonic; ComponentLink7Description: https://datasheet.octopart.com:443/10-84-4022-Molex-datasheet-33343972.pdf?src-supplier=Electro+Sonic; ComponentLink8URL: https://datasheet.octopart.com:443/10-84-4022-Molex-datasheet-21205596.pdf?src-supplier=Electro+Sonic; ComponentLink8Description: https://datasheet.octopart.com:443/10-84-4022-Molex-datasheet-21205596.pdf?src-supplier=Electro+Sonic; ComponentLink9URL: https://datasheet.octopart.com:443/10-84-4022-Molex-datasheet-62102692.pdf?src-supplier=Electro+Sonic; ComponentLink9Description: https://datasheet.octopart.com:443/10-84-4022-Molex-datasheet-62102692.pdf?src-supplier=Electro+Sonic; ComponentLink10URL: https://datasheet.octopart.com:443/10-84-4022-Molex-datasheet-140174504.pdf?src-supplier=RS+(Formerly+Allied+Electronics); ComponentLink10Description: https://datasheet.octopart.com:443/10-84-4022-Molex-datasheet-140174504.pdf?src-supplier=RS+(Formerly+Allied+Electronics); ComponentLink11URL: https://datasheet.octopart.com:443/10-84-4022-Molex-datasheet-120134962.pdf?src-supplier=RS+(Formerly+Allied+Electronics); ComponentLink11Description: https://datasheet.octopart.com:443/10-84-4022-Molex-datasheet-120134962.pdf?src-supplier=RS+(Formerly+Allied+Electronics); ComponentLink12URL: https://datasheet.octopart.com:443/10-84-4022-Molex-datasheet-32867450.pdf?src-supplier=Newark; ComponentLink12Description: https://datasheet.octopart.com:443/10-84-4022-Molex-datasheet-32867450.pdf?src-supplier=Newark; ComponentLink13URL: https://datasheet.octopart.com:443/10844022-Molex-datasheet-8320017.pdf?src-supplier=Jameco+(USA); ComponentLink13Description: https://datasheet.octopart.com:443/10844022-Molex-datasheet-8320017.pdf?src-supplier=Jameco+(USA); ComponentLink14URL: https://datasheet.octopart.com:443/10-84-4022-Molex-datasheet-5314522.pdf?src-supplier=Verical; ComponentLink14Description: https://datasheet.octopart.com:443/10-84-4022-Molex-datasheet-5314522.pdf?src-supplier=Verical; ComponentLink15URL: https://datasheet.octopart.com:443/10-84-4022-Molex-datasheet-27226.pdf?src-supplier=DigiKey; ComponentLink15Description: https://datasheet.octopart.com:443/10-84-4022-Molex-datasheet-27226.pdf?src-supplier=DigiKey; ComponentLink16URL: http://sigma.octopart.com:80/16272275/rohs_statement/Molex-10-84-4022.pdf?src-supplier=Compliance+Statements; ComponentLink16Description: http://sigma.octopart.com:80/16272275/rohs_statement/Molex-10-84-4022.pdf?src-supplier=Compliance+Statements; ComponentLink17URL: http://sigma.octopart.com:80/reach_statement/Molex-company-74.pdf?src-supplier=Compliance+Statements; ComponentLink17Description: http://sigma.octopart.com:80/reach_statement/Molex-company-74.pdf?src-supplier=Compliance+Statements; ComponentLink18URL: http://sigma.octopart.com:80/rohs_statement/Molex-company-73.pdf?src-supplier=Compliance+Statements; ComponentLink18Description: http://sigma.octopart.com:80/rohs_statement/Molex-company-73.pdf?src-supplier=Compliance+Statements; ComponentLink19URL: http://sigma.octopart.com:80/conflict_mineral_statement/Molex-company-72.pdf?src-supplier=Compliance+Statements; ComponentLink19Description: http://sigma.octopart.com:80/conflict_mineral_statement/Molex-company-72.pdf?src-supplier=Compliance+Statements; Supplier Part Number 1: WM1263-ND; LINK: https://www.lcsc.com/product-detail/C6955946.html?s_z=n_q_p_0010844022&spm=wm.ssy.bg.0.xh&lcsc_vid=FlMMUgJST1FcAwECRwALVlxQQAdaX1xfRFUPAlJUQFExVlNeTlFaV1NTRVlYVTsOAxUeFF5JWBYZEEoKFBINSQcJGk4MFQUIE0wKAhAHHg1BVlVWWQkaCgg%3D
R1-R4 R6-R8 R33 R34 R39 R40 = RES_SMD 10K 1% 1/4W 0805: Res Thick Film 0805 10K Ohm 1% 0.125W(1/8W) ±100ppm/C Pad SMD Automotive T/R; Manufacturer: Vishay; Manufacturer Part Number: CRCW080510K0FKEA; Manufacturer Package Identifier: CRCW0805-e3; Power Dissipation: 125mW; Power Rating: 120mW; Resistance: 10kΩ; Temperature Coefficient: 100ppm/°C; Voltage Rating: 150V; LIB MADE BY: MR HOANG; Supplier 1: DigiKey; RoHS: Compliant; Category: Chip SMD Resistors; Stock 1: 1195000; Pricing 1: 5000=0.00769, 10000=0.00759, 15000=0.00754, 25000=0.00749, 35000=0.00745, 50000=0.0073, 60000=0.00718, 120000=0.00678, 125000=0.00676 (USD); Case/Package: 0805; Case Code (Imperial): 0805; China RoHS: Non-Compliant; Composition: Thick Film; Contact Plating: Tin; Country of Origin: Israel; Depth: 1.25mm; Export Control Classification Number (ECCN) Code: EAR99; Height: 450µm; Harmonized Tariff Schedule (HTS) Code: 8533.21.00.30; Introduction Date: 2005-02-16; Lead Free: Lead Free; Length: 2mm; Lifecycle Status: Production; Max Operating Temperature: 155°C; Military Standard: Not; Min Operating Temperature: -55°C; Mount: Surface Mount; Number of Pins: 2; Number of Terminals: 2; Packaging: Cut Tape; Radiation Hardening: No; REACH SVHC: Yes; Schedule B: 8533210045, 8533210045|8533210045|8533210045|8533210045|8533210045|8533210045|8533210045|8533210045|8533210045|8533210045|8533210045|8533210045|8533210045|8533210045|8533210045|8533210045|8533210045|8533210045|8533210045|8533210045|8533210045|8533210045|8533210045|85; Termination: SMD/SMT; Tolerance: 1%; Voltage Rating (DC): 150V; Weight: 5.499807mg; Width: 1.25mm; Working Voltage: 150V; ComponentLink1URL: https://datasheet.octopart.com:443/CRCW080510K0FKEA-Vishay-datasheet-175423584.pdf?src-supplier=IHS; ComponentLink1Description: https://datasheet.octopart.com:443/CRCW080510K0FKEA-Vishay-datasheet-175423584.pdf?src-supplier=IHS; ComponentLink2URL: https://datasheet.octopart.com:443/CRCW080510K0FKEA-Vishay-datasheet-5300368.pdf?src-supplier=Future+Electronics; ComponentLink2Description: https://datasheet.octopart.com:443/CRCW080510K0FKEA-Vishay-datasheet-5300368.pdf?src-supplier=Future+Electronics; ComponentLink3URL: https://datasheet.octopart.com:443/CRCW080510K0FKEA-Vishay-datasheet-62316122.pdf?src-supplier=Future+Electronics; ComponentLink3Description: https://datasheet.octopart.com:443/CRCW080510K0FKEA-Vishay-datasheet-62316122.pdf?src-supplier=Future+Electronics; ComponentLink4URL: https://datasheet.octopart.com:443/CRCW080510K0FKEA-Vishay-datasheet-83961561.pdf?src-supplier=Newark; ComponentLink4Description: https://datasheet.octopart.com:443/CRCW080510K0FKEA-Vishay-datasheet-83961561.pdf?src-supplier=Newark; ComponentLink5URL: https://datasheet.octopart.com:443/CRCW080510K0FKEA-Vishay-datasheet-14722531.pdf?src-supplier=Newark; ComponentLink5Description: https://datasheet.octopart.com:443/CRCW080510K0FKEA-Vishay-datasheet-14722531.pdf?src-supplier=Newark; ComponentLink6URL: https://datasheet.octopart.com:443/CRCW080510K0FKEA-Vishay-datasheet-62317937.pdf?src-supplier=Newark; ComponentLink6Description: https://datasheet.octopart.com:443/CRCW080510K0FKEA-Vishay-datasheet-62317937.pdf?src-supplier=Newark; ComponentLink7URL: https://datasheet.octopart.com:443/CRCW080510K0FKEA-Vishay-datasheet-11516975.pdf?src-supplier=Newark; ComponentLink7Description: https://datasheet.octopart.com:443/CRCW080510K0FKEA-Vishay-datasheet-11516975.pdf?src-supplier=Newark; ComponentLink8URL: https://datasheet.octopart.com:443/CRCW080510K0FKEA-Vishay-datasheet-183883877.pdf?src-supplier=Newark; ComponentLink8Description: https://datasheet.octopart.com:443/CRCW080510K0FKEA-Vishay-datasheet-183883877.pdf?src-supplier=Newark; ComponentLink9URL: https://datasheet.octopart.com:443/CRCW080510K0FKEA-Vishay-datasheet-41302739.pdf?src-supplier=Newark; ComponentLink9Description: https://datasheet.octopart.com:443/CRCW080510K0FKEA-Vishay-datasheet-41302739.pdf?src-supplier=Newark; ComponentLink10URL: https://datasheet.octopart.com:443/CRCW080510K0FKEA-Vishay-datasheet-27121962.pdf?src-supplier=Newark; ComponentLink10Description: https://datasheet.octopart.com:443/CRCW080510K0FKEA-Vishay-datasheet-27121962.pdf?src-supplier=Newark; ComponentLink11URL: https://datasheet.octopart.com:443/CRCW080510K0FKEA-Vishay-datasheet-16179825.pdf?src-supplier=element14+APAC; ComponentLink11Description: https://datasheet.octopart.com:443/CRCW080510K0FKEA-Vishay-datasheet-16179825.pdf?src-supplier=element14+APAC; ComponentLink12URL: https://datasheet.octopart.com:443/CRCW080510K0FKEA-Vishay-datasheet-66077789.pdf?src-supplier=element14+APAC; ComponentLink12Description: https://datasheet.octopart.com:443/CRCW080510K0FKEA-Vishay-datasheet-66077789.pdf?src-supplier=element14+APAC; ComponentLink13URL: https://datasheet.octopart.com:443/CRCW080510K0FKEA-Vishay-datasheet-5306405.pdf?src-supplier=RS+(Formerly+Allied+Electronics); ComponentLink13Description: https://datasheet.octopart.com:443/CRCW080510K0FKEA-Vishay-datasheet-5306405.pdf?src-supplier=RS+(Formerly+Allied+Electronics); ComponentLink14URL: https://datasheet.octopart.com:443/CRCW080510K0FKEA-Vishay-Dale-datasheet-47688880.pdf?src-supplier=RS+(Formerly+Allied+Electronics); ComponentLink14Description: https://datasheet.octopart.com:443/CRCW080510K0FKEA-Vishay-Dale-datasheet-47688880.pdf?src-supplier=RS+(Formerly+Allied+Electronics); ComponentLink15URL: https://datasheet.octopart.com:443/CRCW080510K0FKEA-Vishay-datasheet-12001583.pdf?src-supplier=RS+(Formerly+Allied+Electronics); ComponentLink15Description: https://datasheet.octopart.com:443/CRCW080510K0FKEA-Vishay-datasheet-12001583.pdf?src-supplier=RS+(Formerly+Allied+Electronics); ComponentLink16URL: https://datasheet.octopart.com:443/CRCW080510K0FKEA-Vishay-datasheet-17834126.pdf?src-supplier=TME; ComponentLink16Description: https://datasheet.octopart.com:443/CRCW080510K0FKEA-Vishay-datasheet-17834126.pdf?src-supplier=TME; ComponentLink17URL: https://datasheet.octopart.com/D-CRCW-e3-Standard-Thick-Film-Chip-Resistors-Vishay-datasheet-family-64.pdf; ComponentLink17Description: https://datasheet.octopart.com/D-CRCW-e3-Standard-Thick-Film-Chip-Resistors-Vishay-datasheet-family-64.pdf; ComponentLink18URL: https://datasheet.octopart.com:443/CRCW080510K0FKEA-Vishay-datasheet-13242068.pdf?src-supplier=Farnell; ComponentLink18Description: https://datasheet.octopart.com:443/CRCW080510K0FKEA-Vishay-datasheet-13242068.pdf?src-supplier=Farnell; ComponentLink19URL: https://datasheet.octopart.com:443/CRCW080510K0FKEA-Vishay-datasheet-13195083.pdf?src-supplier=Farnell; ComponentLink19Description: https://datasheet.octopart.com:443/CRCW080510K0FKEA-Vishay-datasheet-13195083.pdf?src-supplier=Farnell; ComponentLink20URL: https://datasheet.octopart.com:443/CRCW080510K0FKEA-Vishay-datasheet-13034211.pdf?src-supplier=Farnell; ComponentLink20Description: https://datasheet.octopart.com:443/CRCW080510K0FKEA-Vishay-datasheet-13034211.pdf?src-supplier=Farnell; ComponentLink21URL: https://datasheet.octopart.com:443/CRCW080510K0FKEA-Vishay-datasheet-12600034.pdf?src-supplier=Farnell; ComponentLink21Description: https://datasheet.octopart.com:443/CRCW080510K0FKEA-Vishay-datasheet-12600034.pdf?src-supplier=Farnell; ComponentLink22URL: https://datasheet.octopart.com:443/CRCW080510K0FKEA-Vishay-datasheet-12532161.pdf?src-supplier=Farnell; ComponentLink22Description: https://datasheet.octopart.com:443/CRCW080510K0FKEA-Vishay-datasheet-12532161.pdf?src-supplier=Farnell; ComponentLink23URL: https://datasheet.octopart.com:443/CRCW080510K0FKEA-Vishay-datasheet-12517896.pdf?src-supplier=Farnell; ComponentLink23Description: https://datasheet.octopart.com:443/CRCW080510K0FKEA-Vishay-datasheet-12517896.pdf?src-supplier=Farnell; ComponentLink24URL: https://datasheet.octopart.com:443/CRCW080510K0FKEA-Vishay-datasheet-12509762.pdf?src-supplier=Farnell; ComponentLink24Description: https://datasheet.octopart.com:443/CRCW080510K0FKEA-Vishay-datasheet-12509762.pdf?src-supplier=Farnell; ComponentLink25URL: https://datasheet.octopart.com:443/CRCW080510K0FKEA-Vishay-datasheet-10322335.pdf?src-supplier=Farnell; ComponentLink25Description: https://datasheet.octopart.com:443/CRCW080510K0FKEA-Vishay-datasheet-10322335.pdf?src-supplier=Farnell; ComponentLink26URL: https://datasheet.octopart.com:443/CRCW080510K0FKEA-Vishay-datasheet-8788789.pdf?src-supplier=Farnell; ComponentLink26Description: https://datasheet.octopart.com:443/CRCW080510K0FKEA-Vishay-datasheet-8788789.pdf?src-supplier=Farnell; ComponentLink27URL: https://datasheet.octopart.com:443/CRCW080510K0FKEA-Vishay-datasheet-8361388.pdf?src-supplier=Farnell; ComponentLink27Description: https://datasheet.octopart.com:443/CRCW080510K0FKEA-Vishay-datasheet-8361388.pdf?src-supplier=Farnell; ComponentLink28URL: https://datasheet.octopart.com:443/CRCW080510K0FKEA-Vishay-datasheet-546287.pdf?src-supplier=Farnell; ComponentLink28Description: https://datasheet.octopart.com:443/CRCW080510K0FKEA-Vishay-datasheet-546287.pdf?src-supplier=Farnell; ComponentLink29URL: https://datasheet.octopart.com:443/CRCW080510K0FKEA-Vishay-datasheet-11540273.pdf?src-supplier=Arrow+Electronics; ComponentLink29Description: https://datasheet.octopart.com:443/CRCW080510K0FKEA-Vishay-datasheet-11540273.pdf?src-supplier=Arrow+Electronics; ComponentLink30URL: https://datasheet.octopart.com:443/CRCW080510K0FKEA-Vishay-datasheet-8445837.pdf?src-supplier=element14; ComponentLink30Description: https://datasheet.octopart.com:443/CRCW080510K0FKEA-Vishay-datasheet-8445837.pdf?src-supplier=element14; ComponentLink31URL: https://datasheet.octopart.com:443/CRCW080510K0FKEA-Vishay-datasheet-5377306.pdf?src-supplier=Garrett; ComponentLink31Description: https://datasheet.octopart.com:443/CRCW080510K0FKEA-Vishay-datasheet-5377306.pdf?src-supplier=Garrett; ComponentLink32URL: https://datasheet.octopart.com:443/CRCW080510K0FKEA-Vishay-datasheet-148188.pdf?src-supplier=Garrett; ComponentLink32Description: https://datasheet.octopart.com:443/CRCW080510K0FKEA-Vishay-datasheet-148188.pdf?src-supplier=Garrett; ComponentLink33URL: https://datasheet.octopart.com:443/CRCW080510K0FKEA-Vishay-datasheet-34203.pdf?src-supplier=Garrett; ComponentLink33Description: https://datasheet.octopart.com:443/CRCW080510K0FKEA-Vishay-datasheet-34203.pdf?src-supplier=Garrett; ComponentLink34URL: http://sigma.octopart.com:80/rohs_certificate/D-CRCW-e3-Standard-Thick-Film-Chip-Resistors-Vishay-family-102.pdf?src-supplier=Compliance+Statements; ComponentLink34Description: http://sigma.octopart.com:80/rohs_certificate/D-CRCW-e3-Standard-Thick-Film-Chip-Resistors-Vishay-family-102.pdf?src-supplier=Compliance+Statements; Supplier Part Number 1: 541-10.0KCTR-ND; Link: https://linhkien.cxtvn.com/6741-dien-tro-10k-0805-1-50c.html
R9-R11 R13-R15 R29 R30 R35 R36 = RES_SMD 220 OHM 1% 1/8W 0805: Res Thick Film 0805 220 Ohm 1% 0.125W(1/8W) ±100ppm/C Pad SMD Automotive T/R; Manufacturer: TE Connectivity; Manufacturer Part Number: CRGCQ0805F220R; Manufacturer Lifecycle Status: ACTIVE; Operating Supply Voltage: 150V; Power Rating: 125mW; Resistance: 220Ω; Temperature Coefficient: 100ppm/°C; LIB MADE BY: MR HOANG; Supplier 1: DigiKey; RoHS: Compliant; Category: Chip SMD Resistors; Stock 1: 950997; Pricing 1: 5000=0.01095, 10000=0.00993, 15000=0.00943, 25000=0.0089, 35000=0.00859, 50000=0.0083 (USD); Ambient Temperature Range High: 70°C; Case/Package: 0805; China RoHS: Non-Compliant; Composition: Thick Film; Height: 550µm; Length: 2mm; Lifecycle Status: Production; Max Operating Temperature: 155°C; Min Operating Temperature: -55°C; Mount: Surface Mount; Number of Terminals: 2; Packaging: Cut Tape; Ratings: AEC-Q200; REACH SVHC: Unaffected; Schedule B: 8533210025, 8533210025|8533210025|8533210025|8533210025|8533210025, 8533210045; Tolerance: 1%; Voltage Rating: 150V; Voltage Rating (DC): 150V; Width: 1.25mm; Working Voltage: 150V; ComponentLink1URL: https://datasheet.octopart.com:443/CRGCQ0805F220R-TE-Connectivity-datasheet-114679081.pdf?src-supplier=JRH+Electronics; ComponentLink1Description: https://datasheet.octopart.com:443/CRGCQ0805F220R-TE-Connectivity-datasheet-114679081.pdf?src-supplier=JRH+Electronics; ComponentLink2URL: https://sigma.octopart.com:443/114695583/technical_drawing/TE-Connectivity-CRGCQ0805F220R.pdf?src-supplier=Sager+Electronics; ComponentLink2Description: https://sigma.octopart.com:443/114695583/technical_drawing/TE-Connectivity-CRGCQ0805F220R.pdf?src-supplier=Sager+Electronics; ComponentLink3URL: https://datasheet.octopart.com:443/1-2176341-7-TE-Connectivity---AMP-datasheet-189108688.pdf?src-supplier=Master+Electronics; ComponentLink3Description: https://datasheet.octopart.com:443/1-2176341-7-TE-Connectivity---AMP-datasheet-189108688.pdf?src-supplier=Master+Electronics; Supplier Part Number 1: A129741TR-ND; LINK: https://linhkien.cxtvn.com/2742-dien-tro-220r-0805-1-100c.html